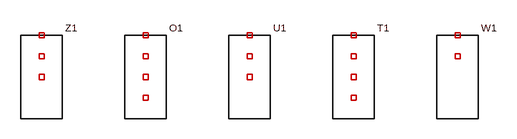
[diagram p0: schematic elements.asc]
elements.asc, the LTspice schematic file:
Version 4
SHEET 1 880 680
SYMBOL z3 96 160 R0
SYMATTR InstName Z1
SYMBOL o4 256 160 R0
SYMATTR InstName O1
SYMBOL u3 416 160 R0
SYMATTR InstName U1
SYMBOL t4 576 160 R0
SYMATTR InstName T1
SYMBOL w2 736 160 R0
SYMATTR InstName W1

The netlist it stands for:
* elements.asc
Z1 NC_01 NC_02 NC_03 nmf
O1 NC_04 NC_05 NC_06 NC_07 lossy
U1 NC_08 NC_09 NC_10 rcline
T1 NC_11 NC_12 NC_13 NC_14 Td=50n Z0=50
W1 NC_15 NC_16 Vsense sw
.backanno
.end